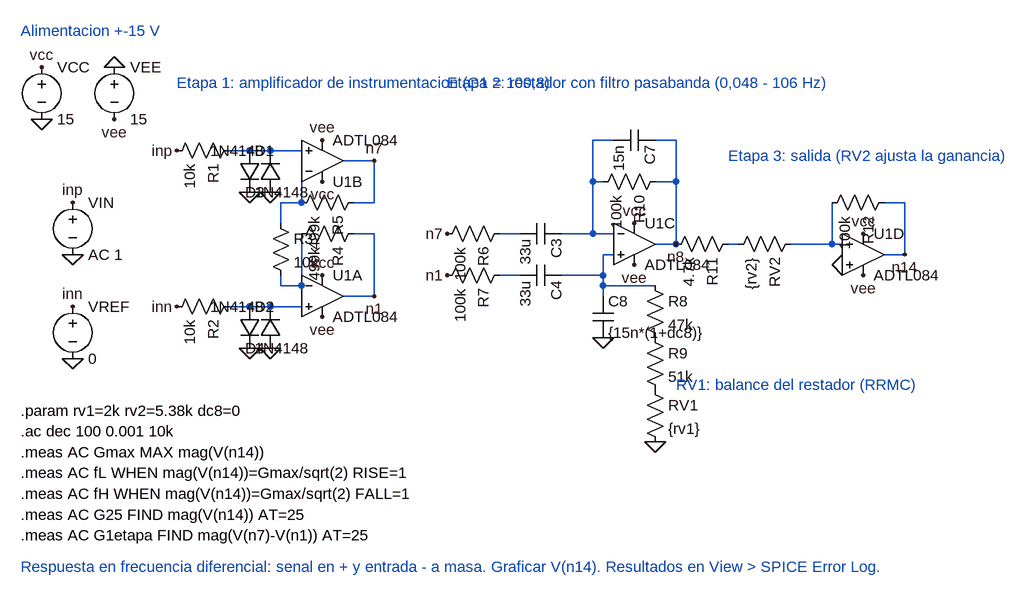
[diagram p0: schematic ea2_tp3_ac_diferencial.asc]
ea2_tp3_ac_diferencial.asc, the LTspice schematic file:
Version 4
SHEET 1 1600 900
SYMBOL voltage 128 96 R0
SYMATTR InstName VCC
SYMATTR Value 15
FLAG 128 112 vcc
FLAG 128 192 0
SYMBOL voltage 240 96 R0
SYMATTR InstName VEE
SYMATTR Value 15
FLAG 240 112 0
FLAG 240 192 vee
TEXT 96 56 Left 2 ;Alimentacion +-15 V
SYMBOL res 432 224 R90
SYMATTR InstName R1
SYMATTR Value 10k
FLAG 336 240 inp
SYMBOL diode 432 240 R0
SYMATTR InstName D1
SYMATTR Value 1N4148
SYMBOL diode 496 304 R180
SYMATTR InstName D3
SYMATTR Value 1N4148
FLAG 448 304 0
FLAG 480 304 0
WIRE 416 240 448 240
WIRE 448 240 480 240
WIRE 480 240 528 240
SYMBOL res 432 464 R90
SYMATTR InstName R2
SYMATTR Value 10k
FLAG 336 480 inn
SYMBOL diode 432 480 R0
SYMATTR InstName D2
SYMATTR Value 1N4148
SYMBOL diode 496 544 R180
SYMATTR InstName D4
SYMATTR Value 1N4148
FLAG 448 544 0
FLAG 480 544 0
WIRE 416 480 448 480
WIRE 448 480 480 480
WIRE 480 480 528 480
SYMBOL OpAmps\\ADTL084 560 320 M180
SYMATTR InstName U1B
FLAG 560 288 vcc
FLAG 560 224 vee
SYMBOL res 624 304 R90
SYMATTR InstName R5
SYMATTR Value 499k
WIRE 528 272 528 320
WIRE 592 256 640 256
WIRE 640 256 640 320
WIRE 640 320 608 320
FLAG 640 256 n7
SYMBOL res 480 336 R0
SYMATTR InstName R3
SYMATTR Value 10k
WIRE 528 320 496 320
WIRE 496 320 496 352
WIRE 496 432 496 448
WIRE 496 448 528 448
SYMBOL OpAmps\\ADTL084 560 400 R0
SYMATTR InstName U1A
FLAG 560 432 vcc
FLAG 560 496 vee
SYMBOL res 624 352 R90
SYMATTR InstName R4
SYMATTR Value 499k
WIRE 528 368 528 448
WIRE 592 464 640 464
WIRE 640 464 640 368
WIRE 640 368 608 368
FLAG 640 464 n1
TEXT 336 136 Left 2 ;Etapa 1: amplificador de instrumentacion (G1 = 100,8)
SYMBOL res 848 352 R90
SYMATTR InstName R6
SYMATTR Value 100k
FLAG 752 368 n7
SYMBOL cap 928 352 R90
SYMATTR InstName C3
SYMATTR Value 33u
WIRE 832 368 864 368
WIRE 928 368 976 368
WIRE 976 368 1008 368
WIRE 976 368 976 288
WIRE 976 288 992 288
WIRE 976 288 976 224
WIRE 976 224 1008 224
SYMBOL res 1088 272 R90
SYMATTR InstName R10
SYMATTR Value 100k
SYMBOL cap 1072 208 R90
SYMATTR InstName C7
SYMATTR Value 15n
WIRE 1072 224 1104 224
WIRE 1104 224 1104 288
WIRE 1072 288 1104 288
WIRE 1104 288 1104 384
WIRE 1104 384 1072 384
SYMBOL OpAmps\\ADTL084 1040 320 R0
SYMATTR InstName U1C
FLAG 1040 352 vcc
FLAG 1040 416 vee
SYMBOL res 848 416 R90
SYMATTR InstName R7
SYMATTR Value 100k
FLAG 752 432 n1
SYMBOL cap 928 416 R90
SYMATTR InstName C4
SYMATTR Value 33u
WIRE 832 432 864 432
WIRE 928 432 992 432
WIRE 992 432 992 400
WIRE 992 400 1008 400
WIRE 992 432 992 448
WIRE 992 448 992 464
WIRE 992 448 1072 448
SYMBOL cap 976 464 R0
SYMATTR InstName C8
SYMATTR Value {15n*(1+dc8)}
FLAG 992 528 0
SYMBOL res 1056 432 R0
SYMATTR InstName R8
SYMATTR Value 47k
SYMBOL res 1056 512 R0
SYMATTR InstName R9
SYMATTR Value 51k
SYMBOL res 1056 592 R0
SYMATTR InstName RV1
SYMATTR Value {rv1}
FLAG 1072 688 0
FLAG 1104 384 n8
TEXT 752 136 Left 2 ;Etapa 2: restador con filtro pasabanda (0,048 - 106 Hz)
TEXT 1104 600 Left 2 ;RV1: balance del restador (RRMC)
SYMBOL res 1200 368 R90
SYMATTR InstName R11
SYMATTR Value 4.7k
SYMBOL res 1296 368 R90
SYMATTR InstName RV2
SYMATTR Value {rv2}
WIRE 1184 384 1200 384
WIRE 1280 384 1344 384
WIRE 1344 384 1360 384
SYMBOL OpAmps\\ADTL084 1392 336 R0
SYMATTR InstName U1D
FLAG 1360 416 0
FLAG 1392 368 vcc
FLAG 1392 432 vee
SYMBOL res 1440 304 R90
SYMATTR InstName R12
SYMATTR Value 100k
WIRE 1344 320 1344 384
WIRE 1424 320 1456 320
WIRE 1456 320 1456 400
WIRE 1456 400 1424 400
FLAG 1456 400 n14
TEXT 1184 248 Left 2 ;Etapa 3: salida (RV2 ajusta la ganancia)
SYMBOL voltage 176 304 R0
SYMATTR InstName VIN
SYMATTR Value AC 1
FLAG 176 320 inp
FLAG 176 400 0
SYMBOL voltage 176 464 R0
SYMATTR InstName VREF
SYMATTR Value 0
FLAG 176 480 inn
FLAG 176 560 0
TEXT 96 640 Left 2 !.param rv1=2k rv2=5.38k dc8=0
TEXT 96 672 Left 2 !.ac dec 100 0.001 10k
TEXT 96 704 Left 2 !.meas AC Gmax MAX mag(V(n14))
TEXT 96 736 Left 2 !.meas AC fL WHEN mag(V(n14))=Gmax/sqrt(2) RISE=1
TEXT 96 768 Left 2 !.meas AC fH WHEN mag(V(n14))=Gmax/sqrt(2) FALL=1
TEXT 96 800 Left 2 !.meas AC G25 FIND mag(V(n14)) AT=25
TEXT 96 832 Left 2 !.meas AC G1etapa FIND mag(V(n7)-V(n1)) AT=25
TEXT 96 880 Left 2 ;Respuesta en frecuencia diferencial: senal en + y entrada - a masa. Graficar V(n14). Resultados en View > SPICE Error Log.

The netlist it stands for:
* ea2_tp3_ac_diferencial.asc
VCC vcc 0 15
VEE 0 vee 15
R1 N001 inp 10k
D1 N001 0 1N4148
D3 0 N001 1N4148
R2 N002 inn 10k
D2 N002 0 1N4148
D4 0 N002 1N4148
XU1B N001 N003 vcc vee n7 ADTL084  ; pins In+ In- V+ V- OUT
R5 n7 N003 499k
R3 N003 N004 10k
XU1A N002 N004 vcc vee n1 ADTL084  ; pins In+ In- V+ V- OUT
R4 n1 N004 499k
R6 N005 n7 100k
C3 N006 N005 33u
R10 n8 N006 100k
C7 n8 N006 15n
XU1C N008 N006 vcc vee n8 ADTL084  ; pins In+ In- V+ V- OUT
R7 N007 n1 100k
C4 N008 N007 33u
C8 N008 0 {15n*(1+dc8)}
R8 N008 P001 47k
R9 P001 P002 51k
RV1 P002 0 {rv1}
R11 N009 n8 4.7k
RV2 N010 N009 {rv2}
XU1D 0 N010 vcc vee n14 ADTL084  ; pins In+ In- V+ V- OUT
R12 n14 N010 100k
VIN inp 0 AC 1
VREF inn 0 0
.model D D
.lib standard.dio
* Alimentacion +-15 V
* Etapa 1: amplificador de instrumentacion (G1 = 100,8)
* Etapa 2: restador con filtro pasabanda (0,048 - 106 Hz)
* RV1: balance del restador (RRMC)
* Etapa 3: salida (RV2 ajusta la ganancia)
.param rv1=2k rv2=5.38k dc8=0
.ac dec 100 0.001 10k
.meas AC Gmax MAX mag(V(n14))
.meas AC fL WHEN mag(V(n14))=Gmax/sqrt(2) RISE=1
.meas AC fH WHEN mag(V(n14))=Gmax/sqrt(2) FALL=1
.meas AC G25 FIND mag(V(n14)) AT=25
.meas AC G1etapa FIND mag(V(n7)-V(n1)) AT=25
* Respuesta en frecuencia diferencial: senal en + y entrada - a masa. Graficar V(n14). Resultados en View > SPICE Error Log.
.lib ADTL084.lib
.backanno
.end